# Altium project HPM5151-EVK-Lite.PrjPcb
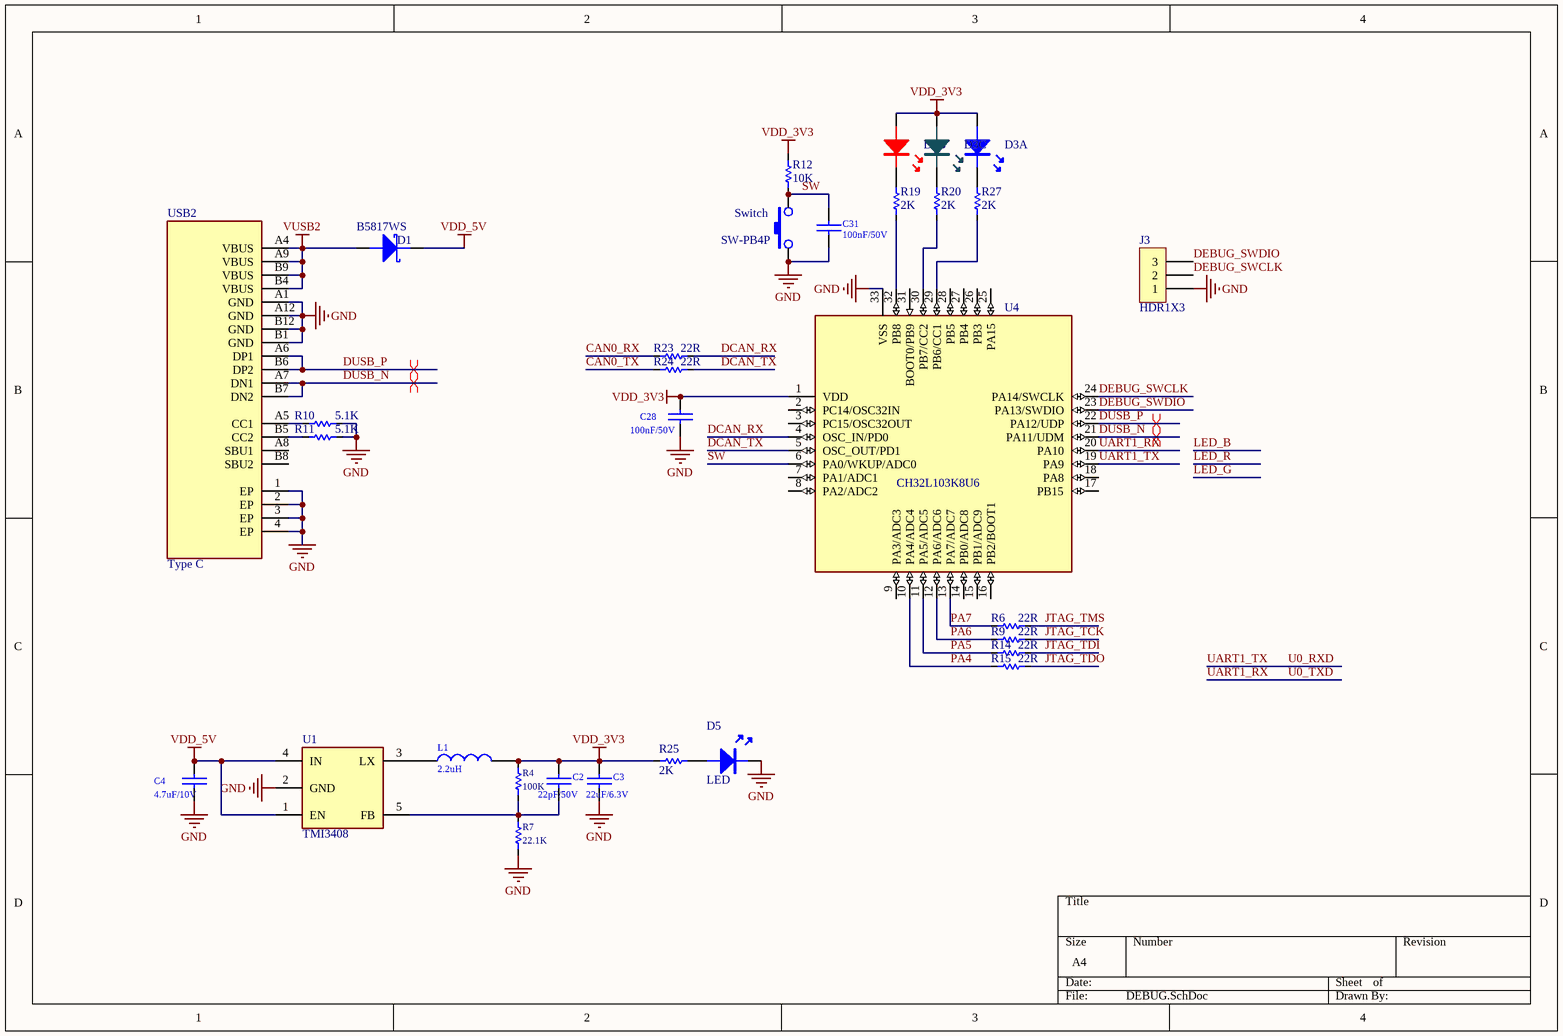
[diagram p0: DEBUG.SchDoc]
3 sheets, 80 parts. Net scope: global (net labels, ports and power ports of the same name join across sheets).
Board file: HPM5151-EVK-Lite.PcbDoc
Sheets:
  DEBUG.SchDoc
  MCU.SchDoc
  CAN_LIN.SchDoc

## Sheet DEBUG.SchDoc
size A4; SheetNumber: 1; SheetTotal: 3

### Parts
C2  22pF/50V  [C0402]
C3  22uF/6.3V  [C0603]
C4  4.7uF/10V  [C0402]
C28  100nF/50V  [C0402]
C31  100nF/50V  [C0402]
D1  B5817WS  [SOD-323]
D3  LED  [SMD_4P-L2.2-W2.1-BR]  (value not drawn)  (parts A,B,C of 3)
D5  LED  [LED0402 GREEN]
J3  HDR1X3  [1.27-3PIN]
L1  2.2uH  [L0603]
R4  100K  [R0402]
R6  22R  [R0402]
R7  22.1K  [R0402]
R9  22R  [R0402]
R10  5.1K  [R0402]
R11  5.1K  [R0402]
R12  10K  [R0402]
R14  22R  [R0402]
R15  22R  [R0402]
R19  2K  [R0402]
R20  2K  [R0402]
R23  22R  [R0402]
R24  22R  [R0402]
R25  2K  [R0402]
R27  2K  [R0402]
Switch  SW-PB4P  [SW-PB4P]
U1  TMI3408  [SOT-23-5]
U4  CH32L103K8U6  [QFN32_4*4]
USB2  Type C  [TYPE-C-16PIN-CB1.6]

### Nets
GND: C3.2 C4.2 C28.2 C31.1 D5.K J3.1 R7.2 R10.1 R11.1 Switch.1 Switch.2 U1.2(GND) U4.33(VSS) USB2.1(EP) USB2.2(EP) USB2.3(EP) USB2.4(EP) USB2.A1(GND) USB2.A12(GND) USB2.B1(GND) USB2.B12(GND)
VDD_3V3: C2.1 C3.1 C28.1 D3.1 L1.2 R4.1 R12.1 R25.2 U4.1(VDD)
VDD_5V: C4.1 D1.K U1.1(EN) U1.4(IN)
VUSB2: D1.A USB2.A4(VBUS) USB2.A9(VBUS) USB2.B4(VBUS) USB2.B9(VBUS)
CAN0_RX: R23.2
CAN0_TX: R24.2
DCAN_RX: R23.1 U4.4(OSC_IN/PD0)
DCAN_TX: R24.1 U4.5(OSC_OUT/PD1)
DEBUG_SWCLK: J3.2 U4.24(PA14/SWCLK)
DEBUG_SWDIO: J3.3 U4.23(PA13/SWDIO)
DUSB_N: U4.21(PA11/UDM) USB2.A7(DN1) USB2.B7(DN2)
DUSB_P: U4.22(PA12/UDP) USB2.A6(DP1) USB2.B6(DP2)
JTAG_TCK: R9.1
JTAG_TDI: R14.1
JTAG_TDO: R15.1
JTAG_TMS: R6.1
PA4: R15.2 U4.10(PA4/ADC4)
PA5: R14.2 U4.11(PA5/ADC5)
PA6: R9.2 U4.12(PA6/ADC6)
PA7: R6.2 U4.13(PA7/ADC7)
SW: C31.2 R12.2 Switch.3 Switch.4 U4.6(PA0/WKUP/ADC0)
U0_RXD: U4.19(PA9)  [also labelled UART1_TX]  [project net PA01]
U0_TXD: U4.20(PA10)  [also labelled UART1_RX]  [project net PA00]
NetC2_2: C2.2 R4.2 R7.1 U1.5(FB)
NetD3_2: D3.2 R19.2
NetD3_3: D3.3 R20.2
NetD3_4: D3.4 R27.2
NetD5_A: D5.A R25.1
NetL1_1: L1.1 U1.3(LX)
NetR10_2: R10.2 USB2.A5(CC1)
NetR11_2: R11.2 USB2.B5(CC2)
NetR19_1: R19.1 U4.32(PB8)
NetR20_1: R20.1 U4.30(PB7/CC2)
NetR27_1: R27.1 U4.29(PB6/CC1)

Not connected (* = marked no-connect by the designer): U4 2(PC14/OSC32IN) 3(PC15/OSC32OUT) 7(PA1/ADC1) 8(PA2/ADC2) 9(PA3/ADC3) 14(PB0/ADC8) 15(PB1/ADC9) 16(PB2/BOOT1) 17(PB15) 18(PA8) 25(PA15) 26(PB3) 27(PB4) 28(PB5) 31(BOOT0/PB9); USB2 A8(SBU1) B8(SBU2)

### Layout directives
differential pair: DUSB_N, DUSB_P

### Library data of the parts
C2 = Cap: Capacitor; Manufacturer: FH(风华); PreferredModel: 0402CG220J500NT; Name: Capacitance; WeldingType: SMD; JLC-Code: C1555
C3 = Cap: Capacitor; Manufacturer: FH(风华); PreferredModel: 0603X226M6R3NT; Name: Capacitance; WeldingType: SMD; JLC-Code: C94018
C4 = Cap: Capacitor; Manufacturer: SAMSUNG; PreferredModel: CL05A475KP5NRNC; Name: Capacitance; WeldingType: SMD; JLC-Code: C368809
C28 C31 = Cap: Capacitor; Manufacturer: SAMSUNG(三星); PreferredModel: CL05B104KB54PNC; Name: Capacitance; WeldingType: SMD; JLC-Code: C307331
D1 = Schottky Diode: Manufacturer: R+O(宏嘉诚); WeldingType: SMD; PreferredModel: B5817WS; Name: Schottky Diode; InternalNumbering: *; JLC-Code: C7420329
D3 = LED_RGB: WeldingType: SMD; PreferredModel: *; Name: LED; Manufacturer: *; InternalNumbering: *; JLC-Code: *
D5 = LED: WeldingType: SMD; PreferredModel: *; Name: LED; Manufacturer: *; InternalNumbering: *; JLC-Code: *
L1 = Inductors: Manufacturer: ZE(增益); PreferredModel: ZEMS160808-2R2M; WeldingType: SMD; Name: Inductors; JLC-Code: C48944989
R4 = Res: Resistance; Manufacturer: UNI-ROYAL(厚声); PreferredModel: 0402WGF1003TCE; WeldingType: SMD; Name: Resistance; JLC-Code: C25741
R6 R9 R14 R15 R23 R24 = Res: Resistance; Manufacturer: UNI-ROYAL(厚声); PreferredModel: 0402WGF220JTCE; WeldingType: SMD; Name: Resistance; JLC-Code: C25092
R7 = Res: Resistance; Manufacturer: UNI-ROYAL(厚声); PreferredModel: 0402WGF2212TCE; WeldingType: SMD; Name: Resistance; JLC-Code: C43473
R10-R12 R19 R20 R25 R27 = Res: Resistance; WeldingType: SMD; Name: Resistance; JLC-Code: *
Switch = SW-PB4P: Manufacturer: DEALON(德艺隆); PreferredModel: TD-1221SR-2.5H-250; Name: Switch; WeldingType: SMD; InternalNumbering: *; JLC-Code: C2905184
U1 = SM8082AAAC: Integrated Circuit; Manufacturer: silergy; Name: LDO; WeldingType: SMD; PreferredModel: SM8082AAAC; JLC-Code: *
U4 = CH32L103K8U6: RISC-V MCU; Manufacturer: WCH; WeldingType: SMD; PreferredModel: CH32L103K8U6; Name: MCU; JLC-Code: *
USB2 = Type C: USB Type C; WeldingType: SMD; PreferredModel: *; Name: USB Type C; Manufacturer: *; InternalNumbering: *; JLC-Code: *

## Sheet MCU.SchDoc
size A4; SheetNumber: 2; SheetTotal: 3
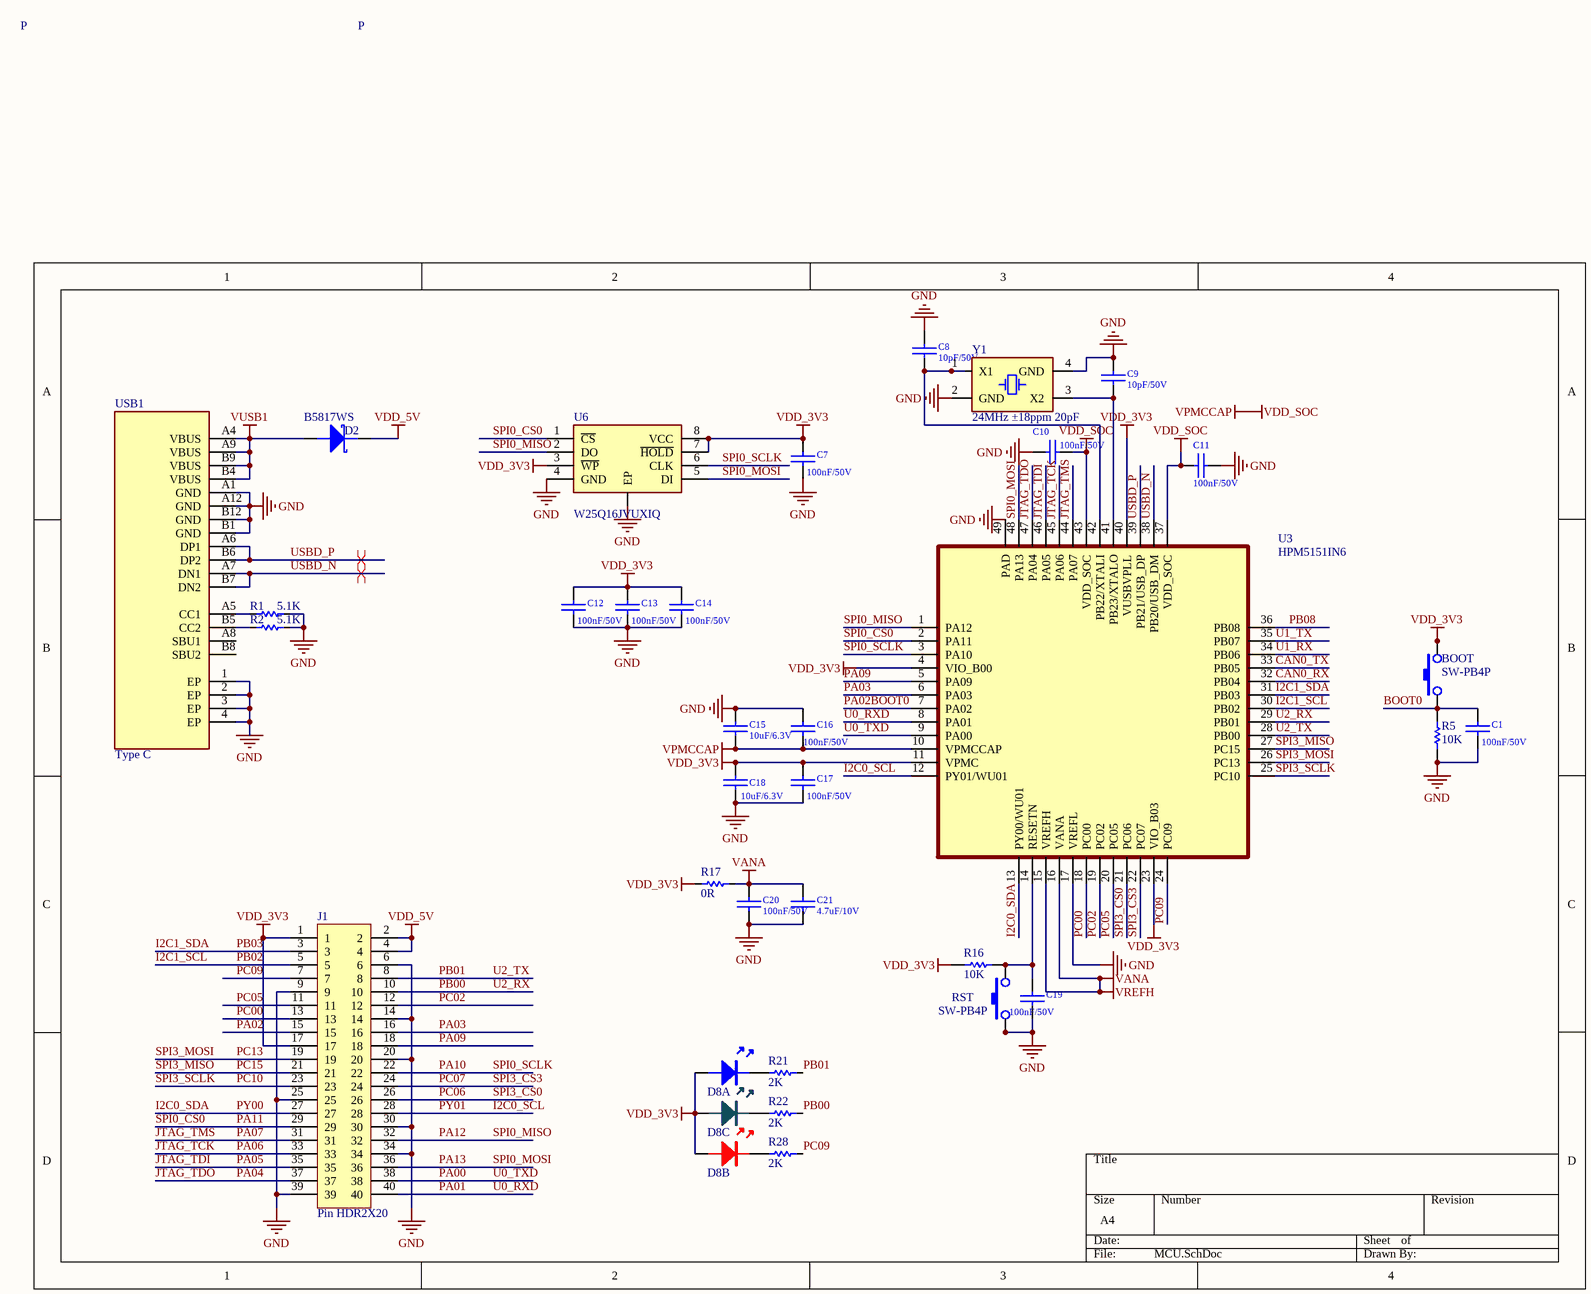
[diagram p1: MCU.SchDoc]

### Parts
BOOT  SW-PB4P  [SW-PB4P]
C1  100nF/50V  [C0402]
C7  100nF/50V  [C0402]
C8  10pF/50V  [C0402]
C9  10pF/50V  [C0402]
C10  100nF/50V  [C0402]
C11  100nF/50V  [C0402]
C12  100nF/50V  [C0402]
C13  100nF/50V  [C0402]
C14  100nF/50V  [C0402]
C15  10uF/6.3V  [C0402]
C16  100nF/50V  [C0402]
C17  100nF/50V  [C0402]
C18  10uF/6.3V  [C0402]
C19  100nF/50V  [C0402]
C20  100nF/50V  [C0402]
C21  4.7uF/10V  [C0402]
D2  B5817WS  [SOD-323]
D8  LED  [SMD_4P-L2.2-W2.1-BR]  (value not drawn)  (parts A,B,C of 3)
J1  Pin HDR2X20  [Pin HDR2X20/2.54mm-S]
R1  5.1K  [R0402]
R2  5.1K  [R0402]
R5  10K  [R0402]
R16  10K  [R0402]
R17  0R  [R0402]
R21  2K  [R0402]
R22  2K  [R0402]
R28  2K  [R0402]
RST  SW-PB4P  [SW-PB4P]
U3  HPM5151IN6  [QFN48 6*6]
U6  W25Q16JVUXIQ  [USON-8-EP(2x3)]
USB1  Type C  [TYPE-C-16PIN-CB1.6]
Y1  24MHz ±18ppm 20pF  [OSC 2016-4P]

### Nets
GND: C1.2 C7.2 C8.2 C9.2 C10.1 C11.2 C12.2 C13.2 C14.2 C15.2 C16.2 C17.2 C18.2 C19.2 C20.2 C21.2 J1.6 J1.9 J1.14 J1.20 J1.25 J1.30 J1.34 J1.39 R1.1 R2.1 R5.1 RST.3 RST.4 U3.17(VREFL) U3.49(PAD) U6.4(GND) U6.9(EP) USB1.1(EP) USB1.2(EP) USB1.3(EP) USB1.4(EP) USB1.A1(GND) USB1.A12(GND) USB1.B1(GND) USB1.B12(GND) Y1.2(GND) Y1.4(GND)
VANA: C20.1 C21.1 R17.1 U3.15(VREFH) U3.16(VANA)  [also labelled VREFH]
VDD_3V3: BOOT.3 BOOT.4 C7.1 C12.1 C13.1 C14.1 C17.1 C18.1 D8.1 J1.1 J1.17 R16.2 R17.2 U3.4(VIO_B00) U3.11(VPMC) U3.23(VIO_B03) U3.40(VUSBVPLL) U6.3(~{WP}) U6.7(~{HOLD}) U6.8(VCC)
VDD_5V: D2.K J1.2 J1.4
VDD_SOC: C10.2 C11.1 C15.1 C16.1 U3.10(VPMCCAP) U3.37(VDD_SOC) U3.43(VDD_SOC)  [also labelled VPMCCAP]
VUSB1: D2.A USB1.A4(VBUS) USB1.A9(VBUS) USB1.B4(VBUS) USB1.B9(VBUS)
BOOT0: BOOT.1 BOOT.2 C1.1 J1.15 R5.2 U3.7(PA02)  [also labelled PA02]
CAN0_RX: U3.32(PB04)
CAN0_TX: U3.33(PB05)
I2C0_SCL: J1.28 U3.12(PY01/WU01)  [also labelled PY01]
I2C0_SDA: J1.27 U3.13(PY00/WU01)  [also labelled PY00]
I2C1_SCL: J1.5 U3.30(PB02)  [also labelled PB02]
I2C1_SDA: J1.3 U3.31(PB03)  [also labelled PB03]
JTAG_TCK: J1.33 U3.45(PA06)  [also labelled PA06]
JTAG_TDI: J1.35 U3.46(PA05)  [also labelled PA05]
JTAG_TDO: J1.37 U3.47(PA04)  [also labelled PA04]
JTAG_TMS: J1.31 U3.44(PA07)  [also labelled PA07]
PA00: J1.38 U3.9(PA00)  [also labelled U0_TXD]
PA01: J1.40 U3.8(PA01)  [also labelled U0_RXD]
PA03: J1.16 U3.6(PA03)
PA09: J1.18 U3.5(PA09)
PA10: J1.22 U3.3(PA10) U6.6(CLK)  [also labelled SPI0_SCLK]
PA11: J1.29 U3.2(PA11) U6.1(~{CS})  [also labelled SPI0_CS0]
PA12: J1.32 U3.1(PA12) U6.2(DO)  [also labelled SPI0_MISO]
PA13: J1.36 U3.48(PA13) U6.5(DI)  [also labelled SPI0_MOSI]
PB00: J1.10 R22.1 U3.29(PB01)  [also labelled U2_RX]
PB01: J1.8 R21.1 U3.28(PB00)  [also labelled U2_TX]
PB08: U3.36(PB08)
PC00: J1.13 U3.18(PC00)
PC02: J1.12 U3.19(PC02)
PC05: J1.11 U3.20(PC05)
PC06: J1.26 U3.21(PC06)  [also labelled SPI3_CS0]
PC07: J1.24 U3.22(PC07)  [also labelled SPI3_CS3]
PC09: J1.7 R28.1 U3.24(PC09)
PC10: J1.23 U3.25(PC10)  [also labelled SPI3_SCLK]
PC13: J1.19 U3.26(PC13)  [also labelled SPI3_MOSI]
PC15: J1.21 U3.27(PC15)  [also labelled SPI3_MISO]
U1_RX: U3.34(PB06)
U1_TX: U3.35(PB07)
USBD_N: U3.38(PB20/USB_DM) USB1.A7(DN1) USB1.B7(DN2)
USBD_P: U3.39(PB21/USB_DP) USB1.A6(DP1) USB1.B6(DP2)
NetC8_1: C8.1 U3.42(PB22/XTALI) Y1.1(X1)
NetC9_1: C9.1 U3.41(PB23/XTALO) Y1.3(X2)
NetC19_1: C19.1 R16.1 RST.1 RST.2 U3.14(RESETN)
NetD8_2: D8.2 R28.2
NetD8_3: D8.3 R22.2
NetD8_4: D8.4 R21.2
NetR1_2: R1.2 USB1.A5(CC1)
NetR2_2: R2.2 USB1.B5(CC2)

Not connected (* = marked no-connect by the designer): USB1 A8(SBU1) B8(SBU2)

### Layout directives
differential pair: USBD_N, USBD_P

### Notes on the sheet
- P

### Library data of the parts
BOOT = SW-PB4P: Manufacturer: DEALON(德艺隆); PreferredModel: TD-1221SR-2.5H-250; Name: Switch; WeldingType: SMD; JCL-Code: C2905184; InternalNumbering: *
C1 C7 C10-C14 C16 C17 C19 C20 = Cap: as C28 on sheet DEBUG; JLC-Code: C307331
C8 C9 = Cap: Capacitor; Manufacturer: muRata(村田); PreferredModel: GRM1555C1H100FA01D; Name: Capacitance; WeldingType: SMD; JCL-Code: C161520
C15 C18 = Cap: Capacitor; Manufacturer: SAMSUNG; PreferredModel: CL05A106MQ5NUNC; Name: Capacitance; WeldingType: SMD; JCL-Code: C15525
C21 = Cap: Capacitor; Manufacturer: SAMSUNG; PreferredModel: CL05A475KP5NRNC; Name: Capacitance; WeldingType: SMD; JCL-Code: C368809
D2 = Schottky Diode: Manufacturer: R+O(宏嘉诚); WeldingType: SMD; PreferredModel: B5817WS; Name: Schottky Diode; InternalNumbering: *; JLC-Code: C7420329
D8 = LED_RGB: WeldingType: SMD; PreferredModel: *; Name: LED; Manufacturer: *; InternalNumbering: *; JLC-Code: *
R1 R2 R21 R22 R28 = Res: Resistance; WeldingType: SMD; Name: Resistance
  R1: JLC-Code: *
  R2 R21 R22 R28: JCL-Code: *
R5 = Res: Resistance; Manufacturer: YAGEO; PreferredModel: AC0402FR-0710KL; WeldingType: SMD; InternalNumbering: GRD1049; JCL-Code: C144807; Name: Resistance
R16 = Res: Resistance; Manufacturer: YAGEO; PreferredModel: AC0402FR-0710KL; WeldingType: SMD; Name: Resistance; JLC-Code: C144807
R17 = Res: Resistance; Manufacturer: UNI-ROYAL(厚声); PreferredModel: 0402WGF0000TCE; WeldingType: SMD; Name: Resistance; JLC-Code: *
RST = SW-PB4P: as Switch on sheet DEBUG; InternalNumbering: *; JLC-Code: C2905184
U3 = HPM5151IN61_1: 32 bit RISC-V MCU; Manufacturer: HPMICRO Semiconductor; WeldingType: SMD; PreferredModel: HPM5151IN61; Name: 32 bit RISC-V MCU; InternalNumbering: *
U6 = W25Q16JVUXIQ: Serial flash memory with DUAL/QUAD SPI; Manufacturer: Winbond; WeldingType: SMD; PreferredModel: W25Q16JVUXIQ; Name: Serial flash memory; InternalNumbering: *; JCL-Code: *
USB1 = Type C: USB Type C; WeldingType: SMD; PreferredModel: *; Name: USB Type C; Manufacturer: *; InternalNumbering: *; JCL-Code: *
Y1 = XTAL_4P: Manufacturer: YXC(扬兴晶振); PreferredModel: XL7EL89COI-111YLC-24M; Name: Crystal oscillator; WeldingType: SMD; JCL-Code: C22434877; InternalNumbering: *

## Sheet CAN_LIN.SchDoc
size A4; SheetNumber: 3; SheetTotal: 3
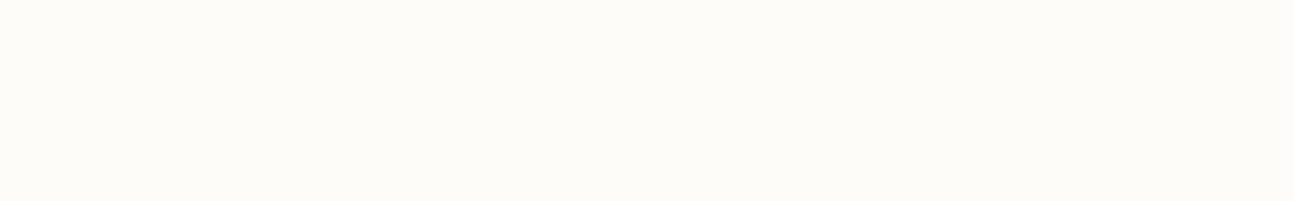
[diagram p2: CAN_LIN.SchDoc, left]
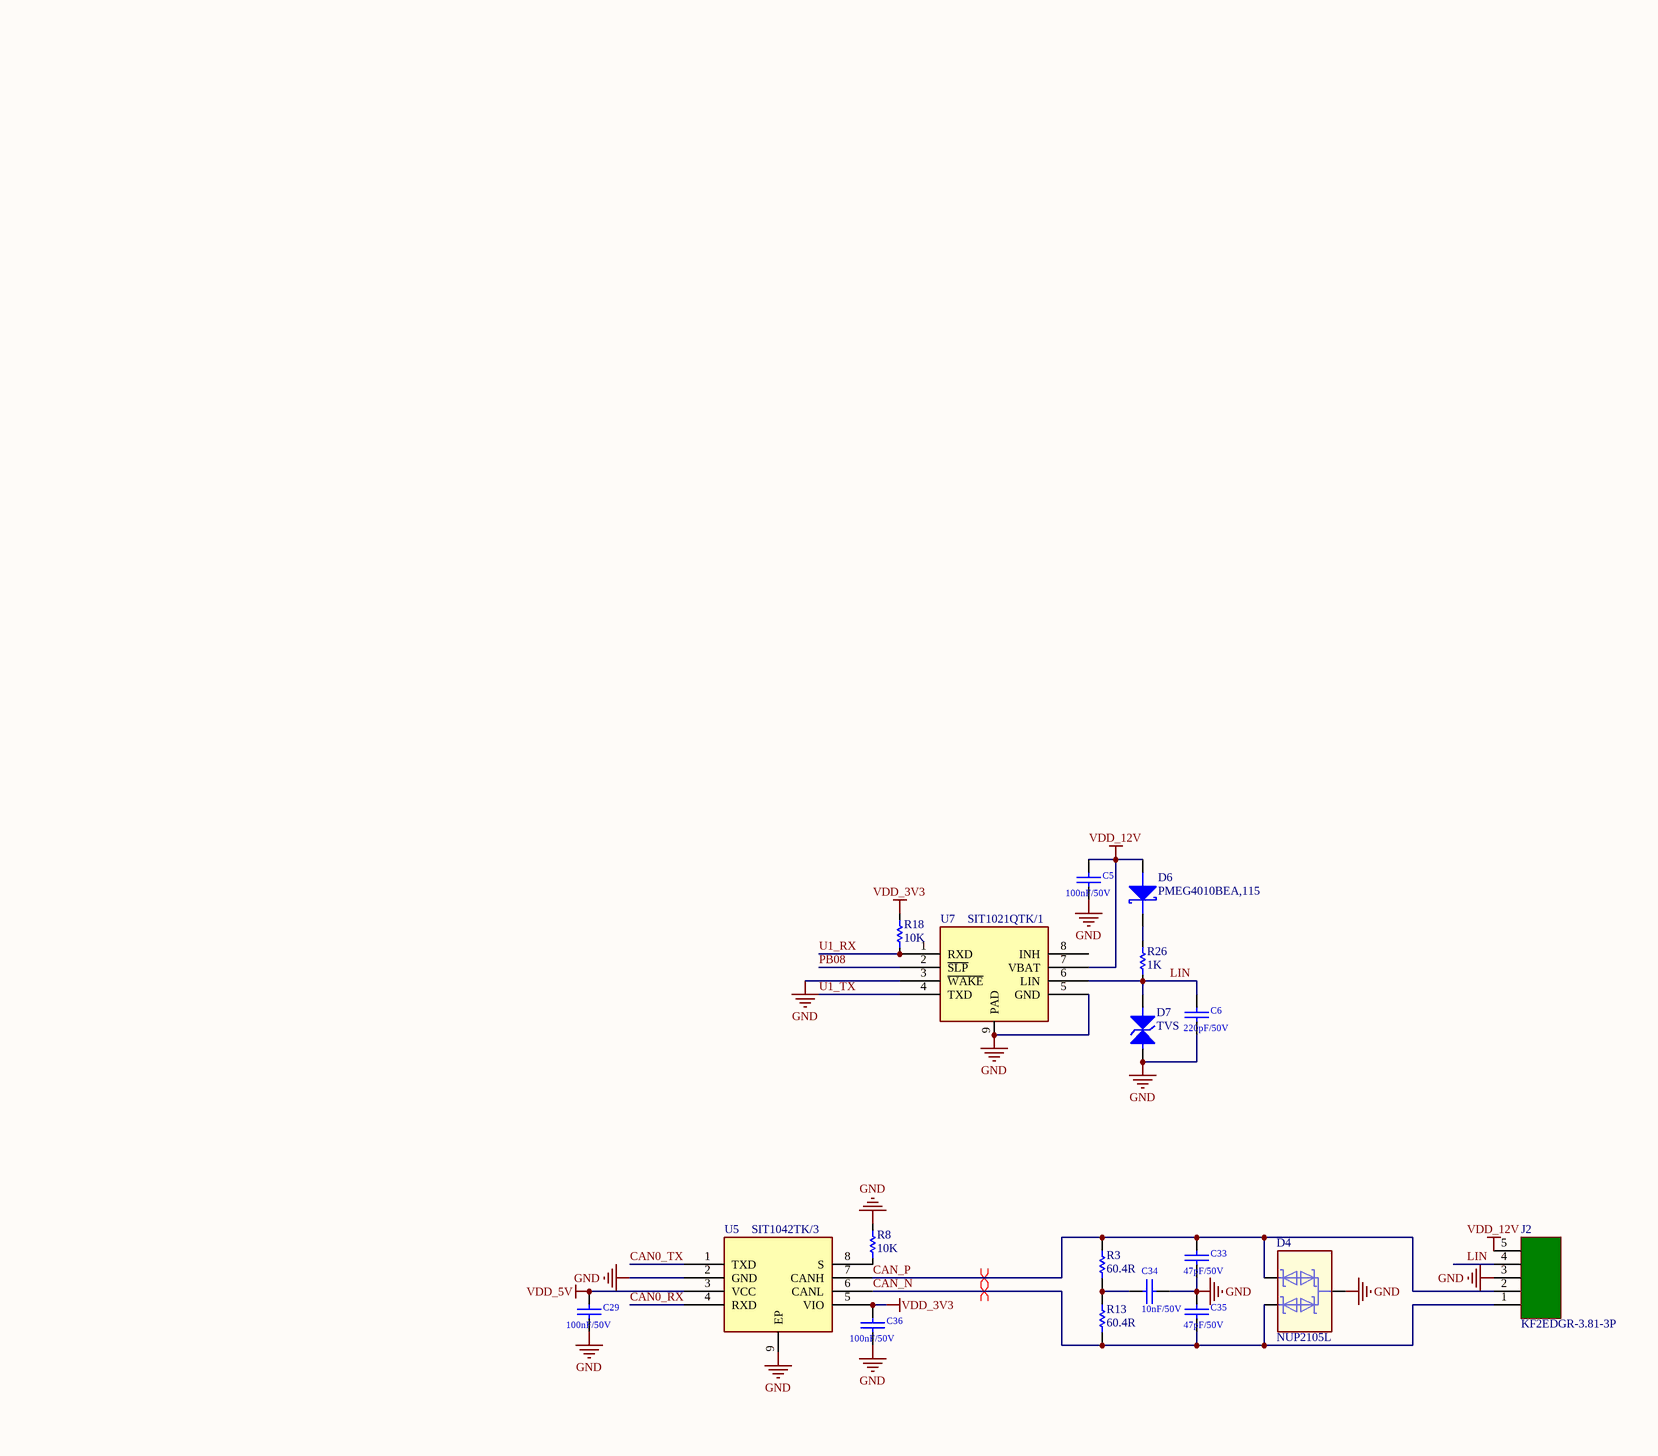
[diagram p3: CAN_LIN.SchDoc, right]

### Parts
C5  100nF/50V  [C0402]
C6  220pF/50V  [C0402]
C29  100nF/50V  [C0402]
C33  47pF/50V  [C0402]
C34  10nF/50V  [C0402]
C35  47pF/50V  [C0402]
C36  100nF/50V  [C0402]
D4  NUP2105L  [SOT-23]
D6  PMEG4010BEA,115  [SOD-323]
D7  TVS  [SOD-323 TVS]
J2  KF2EDGR-3.81-3P  [KF2EDGR-3.81-5P]
R3  60.4R  [R0603]
R8  10K  [R0402]
R13  60.4R  [R0603]
R18  10K  [R0402]
R26  1K  [R0805]
U5  SIT1042TK/3  [HVSON-8-EP(3x3)]
U7  SIT1021QTK/1  [HVSON-8-EP(3X3)]

### Nets
GND: C5.2 C6.1 C29.2 C33.1 C34.1 C35.2 C36.2 D4.3 D7.1 J2.3 R8.1 U5.2(GND) U5.9(EP) U7.3(~{WAKE}) U7.5(GND) U7.9(PAD)
VDD_3V3: C36.1 R18.1 U5.5(VIO)
VDD_5V: C29.1 U5.3(VCC)
VDD_12V: C5.1 D6.A J2.5 U7.7(VBAT)
CAN0_RX: U5.4(RXD)
CAN0_TX: U5.1(TXD)
CAN_N: C35.1 D4.2 J2.1 R13.2 U5.6(CANL)
CAN_P: C33.2 D4.1 J2.2 R3.1 U5.7(CANH)
LIN: C6.2 D7.2 J2.4 R26.2 U7.6(LIN)
PB08: U7.2(~{SLP})
U1_RX: R18.2 U7.1(RXD)
U1_TX: U7.4(TXD)
NetC34_2: C34.2 R3.2 R13.1
NetD6_K: D6.K R26.1
NetR8_2: R8.2 U5.8(S)

Not connected (* = marked no-connect by the designer): U7 8(INH)

### Layout directives
differential pair: CAN_N, CAN_P

### Library data of the parts
C5 C29 = Cap: as C28 on sheet DEBUG; JLC-Code: C307331
C6 = Cap: Capacitor; Manufacturer: Murata; PreferredModel: GCM155R71H221KA37D; Name: Capacitance; WeldingType: SMD; InternalNumbering: GRD1205; JCL-Code: C388904
C33 C35 = Cap: Capacitor; Manufacturer: Murata; PreferredModel: GCM1555C1H470JA16D; Name: Capacitance; WeldingType: SMD; JLC-Code: C126511
C34 = Cap: Capacitor; Manufacturer: Murata; PreferredModel: GCM155R71H103KA55D; Name: Capacitance; WeldingType: SMD; JLC-Code: C91601
C36 = Cap: Capacitor; Manufacturer: Murata; PreferredModel: GCM155R71H104KE02D; Name: Capacitance; WeldingType: SMD; InternalNumbering: GRD1123; JLC-Code: C85858
D4 = NUP2105L: TVS; Manufacturer: TECH PUBLIC(台舟); PreferredModel: NUP2105LT1G; WeldingType: SMD; Name: TVS; InternalNumbering: *; JLC-Code: C2890118
D6 = Schottky Diode: Manufacturer: Nexperia; WeldingType: SMD; PreferredModel: PMEG4010BEA,115; Name: Schottky Diode; InternalNumbering: *; JLC-Code: C36975
D7 = TVS: WeldingType: SMD; PreferredModel: *; Name: TVS; Manufacturer: *; InternalNumbering: *; JLC-Code: *
J2 = KF2EDGR-3.81-5P: Manufacturer: KEFA; PreferredModel: KF2EDGR-3.81-5P; Name: KF2EDGR-3.81-5P; WeldingType: *; JLC-Code: *
R3 = Res: Resistance; Manufacturer: YAGEO; PreferredModel: AC0603FR-0760R4L; WeldingType: SMD; InternalNumbering: GRD1496; Name: Resistance; JLC-Code: C144807
R8 R18 R26 = Res: Resistance; WeldingType: SMD; Name: Resistance; JLC-Code: *
R13 = Res: Resistance; Manufacturer: YAGEO; PreferredModel: AC0603FR-0760R4L; WeldingType: SMD; Name: Resistance; JLC-Code: C144807
U5 = SIT1042TK/3: 5M CAN FD/-40~125℃/AEC-Q100; Manufacturer: SIT; Name: CAN Transceiver; WeldingType: SMD; PreferredModel: SIT1042TK/3; JLC-Code: C38695
U7 = SIT1021QTK/1: 12V LIN/-40~150℃/AEC-Q100; Manufacturer: SIT(芯力特); Name: LIN Transceiver; WeldingType: SMD; PreferredModel: SIT1021QTK/1

## Nets that join several sheets
GND: DEBUG (21 pins), MCU (43 pins), CAN_LIN (16 pins)
VDD_3V3: DEBUG (9 pins), MCU (20 pins), CAN_LIN (C36.1 R18.1 U5.5)
VDD_5V: DEBUG (C4.1 D1.K U1.1 U1.4), MCU (D2.K J1.2 J1.4), CAN_LIN (C29.1 U5.3)
CAN0_RX: DEBUG (R23.2), MCU (U3.32), CAN_LIN (U5.4)
CAN0_TX: DEBUG (R24.2), MCU (U3.33), CAN_LIN (U5.1)
JTAG_TCK: DEBUG (R9.1), MCU (J1.33 U3.45)
JTAG_TDI: DEBUG (R14.1), MCU (J1.35 U3.46)
JTAG_TDO: DEBUG (R15.1), MCU (J1.37 U3.47)
JTAG_TMS: DEBUG (R6.1), MCU (J1.31 U3.44)
PA00: DEBUG (U4.20), MCU (J1.38 U3.9)
PA01: DEBUG (U4.19), MCU (J1.40 U3.8)
PB08: MCU (U3.36), CAN_LIN (U7.2)
U1_RX: MCU (U3.34), CAN_LIN (R18.2 U7.1)
U1_TX: MCU (U3.35), CAN_LIN (U7.4)